# Altium project Main_board1.PrjPcb
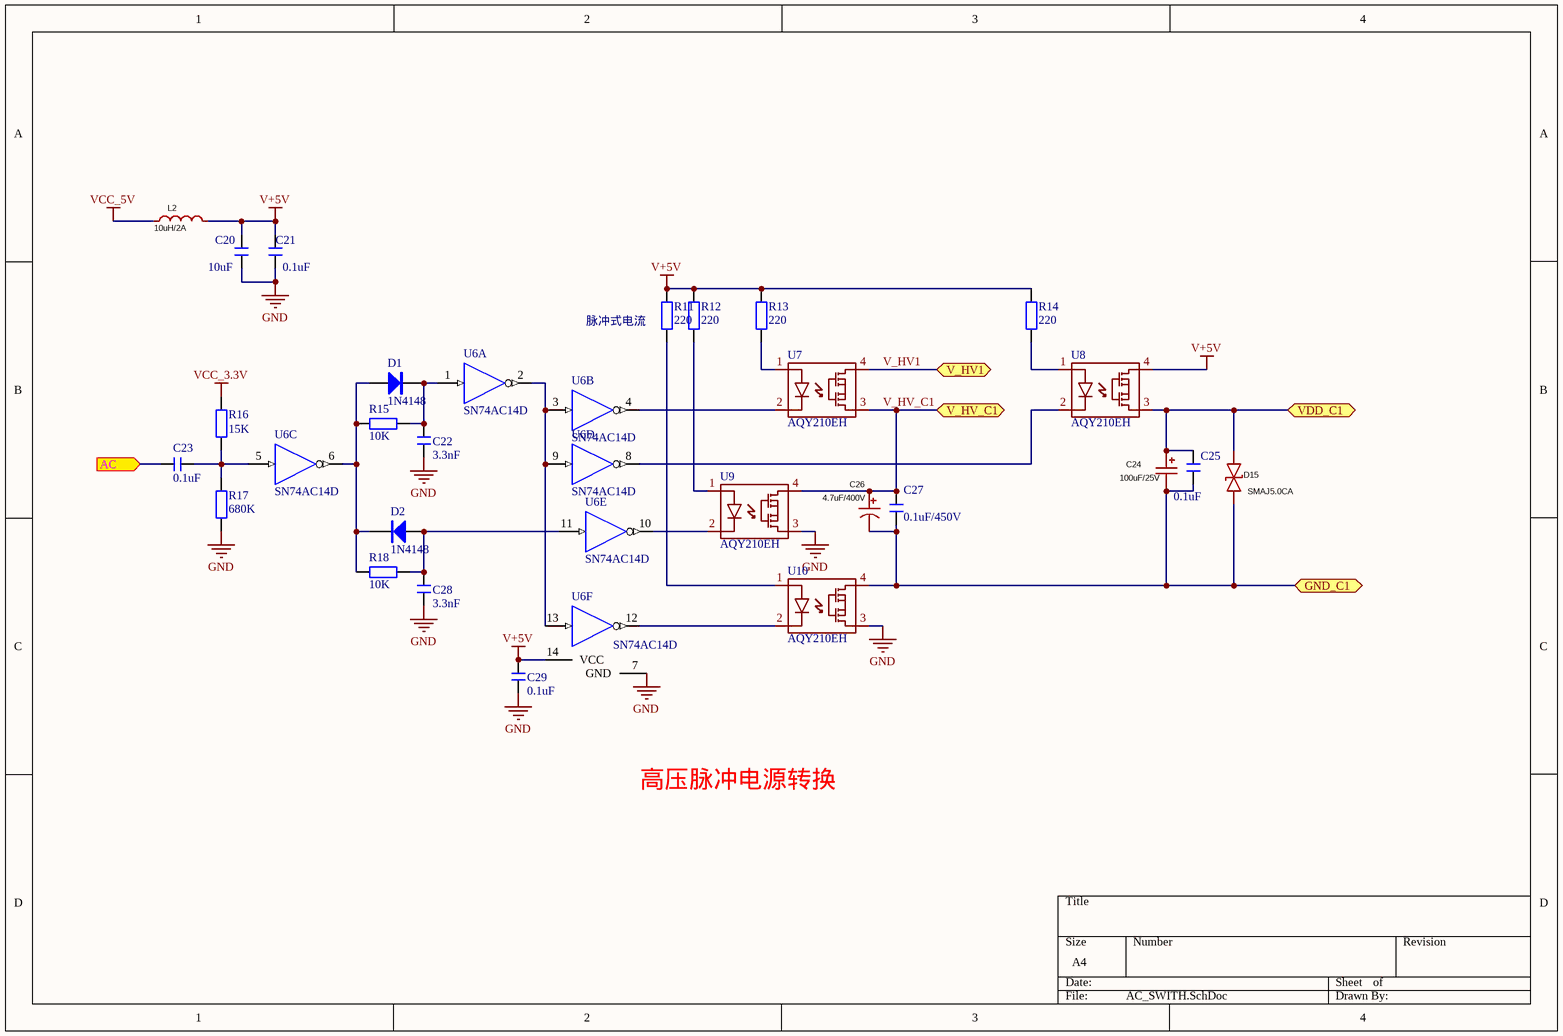
[diagram p0: AC_SWITH.SchDoc]
5 sheets, 102 parts. Net scope: flat (ports and power ports of the same name join across sheets).
Board file: BD1_yd_V1.0.PcbDoc
Sheets:
  AC_SWITH.SchDoc
  ArrayPCIE.SchDoc
  ISO_signal.SchDoc
  Feedback.SchDoc
  Connect.SchDoc

## Sheet AC_SWITH.SchDoc
size A4

### Parts
C20  10uF  [C 0805]
C21  0.1uF  [C 0603]
C22  3.3nF  [C 0603]
C23  0.1uF  [C 0603]
C24  100uF/25V  [CASE-D_7343]
C25  0.1uF  [C 0603]
C26  4.7uF/400V  [CAP-TH_BD8.0-P3.50-D0.6-FD]
C27  0.1uF/450V  [C 1206]
C28  3.3nF  [C 0603]
C29  0.1uF  [C 0603]
D1  1N4148  [SOD-323]
D2  1N4148  [SOD-323]
D15  SMAJ5.0CA  [SMA_L4.4-W2.6-LS5.0-BI]
L2  10uH/2A  [IND-SMD_L5.0-W5.0_LQH5BPBXX]
R11  220  [R 0603]
R12  220  [R 0603]
R13  220  [R 0603]
R14  220  [R 0603]
R15  10K  [R 0603]
R16  15K  [R 0603]
R17  680K  [R 0603]
R18  10K  [R 0603]
U6  SN74AC14D  [SOIC-14_L8.7-W3.9-P1.27-LS6.0-BL]  (parts A,B,C,D,E,F of 6)
U7  AQY210EH  [RELAY-SMD_AQY210EHAX]
U8  AQY210EH  [RELAY-SMD_AQY210EHAX]
U9  AQY210EH  [RELAY-SMD_AQY210EHAX]
U10  AQY210EH  [RELAY-SMD_AQY210EHAX]

### Ports
AC (in), GND_C1, V_HV1, V_HV_C1, VDD_C1

### Nets
GND: C20.1 C21.2 C22.2 C28.2 C29.2 R17.1 U6.7(GND) U9.3(A) U10.3(A)
V+5V: C20.2 C21.1 C29.1 L2.2 R11.1 R12.1 R13.1 R14.1 U6.14(VCC) U8.4(A)
VCC_3.3V: R16.2
VCC_5V: L2.1
GND_C1: C24.2 C25.2 C26.2 C27.1 D15.1 U10.4(A) ; port GND_C1
V_HV1: U7.4(A) ; port V_HV1
V_HV_C1: C26.1 C27.2 U7.3(A) U9.4(A) ; port V_HV_C1
VDD_C1: C24.1 C25.1 D15.2 U8.3(A) ; port VDD_C1
NetC22_1: C22.1 D1.2(K) R15.1 U6.1(A)
NetC23_1: C23.1 R16.1 R17.2 U6.5(A)
NetC23_2: C23.2 ; port AC
NetC28_1: C28.1 D2.1(A) R18.1 U6.11(A)
NetD1_1: D1.1(A) D2.2(K) R15.2 R18.2 U6.6(Y)
NetR11_2: R11.2 U10.1(A)
NetR12_2: R12.2 U9.1(A)
NetR13_2: R13.2 U7.1(A)
NetR14_2: R14.2 U8.1(A)
NetU6_2: U6.2(Y) U6.3(A) U6.9(A) U6.13(A)
NetU6_4: U6.4(Y) U7.2(A)
NetU6_8: U6.8(Y) U8.2(A)
NetU6_10: U6.10(Y) U9.2(A)
NetU6_12: U6.12(Y) U10.2(A)

### Notes on the sheet
- 脉冲式电流
- 高压脉冲电源转换

### Library data of the parts
C20-C23 C25 C27-C29 = C: 无极性贴片电容; 版权归属: 源创客; BOM名称: 无极性贴片电容; 学习资源: www.ooocke.com
C24 = TAJD107K016RNJ: Manufacturer: Kyocera AVX; Add into BOM: yes; Value: 100uF; Rated Voltage: 16V; Symbol: TAJD107K016RNJ; Device: TAJD107K016RNJ; Supplier Part: C7223; Manufacturer Part: TAJD107K016RNJ; Supplier Footprint: CASE-D-7343; JLCPCB Part Class: Extended Part; Datasheet: https://atta.szlcsc.com/upload/public/pdf/source/20160107/1457707750344.pdf; Supplier: LCSC; Convert to PCB: yes
C26 = ERK2GM4R7F09OT: Add into BOM: yes; Value: 4.7uF; Rated Voltage: 400V; Ripple Current: 94mA@100kHz; L: 9mm; Symbol: ERK2GM4R7F09OT; Device: ERK2GM4R7F09OT; Supplier Part: C112499; Manufacturer Part: ERK2GM4R7F09OT; JLCPCB Part Class: Extended Part; Datasheet: https://atta.szlcsc.com/upload/public/pdf/source/20200117/C486002_277F2A16EBB2F90C92EEA28887F58F34.pdf; Supplier: LCSC; Convert to PCB: yes; Equivalent Series Resistance(ESR): -; Lead Spacing: 3.5mm
D1 D2 = 1N4148: 高速开关二极管; 版权归属: 源创客; BOM名称: 高速开关二极管; 学习资源: www.ooocke.com
D15 = SMAJ5.0CA_C83324: Symbol: SMAJ5.0CA-C83324; Add into BOM: yes; Reverse Stand-Off Voltage (Vrwm): 5V; Maximum Clamping Voltage: 9.2V; Peak Pulse Current (Ipp)@10/1000us: 43.5A; Peak Pulse Power Dissipation (Ppp)@10/1000us: 400W; Breakdown Voltage: 6.4V; Type: TVS; Device: SMAJ5.0CA_C83324; Supplier Part: C83324; Manufacturer Part: SMAJ5.0CA; Supplier Footprint: SMA(DO-214AC); JLCPCB Part Class: Extended Part; Datasheet: https://atta.szlcsc.com/upload/public/pdf/source/20190402/C374025_5ACE77BC72947DF13CF0CBC7F8B57228.pdf; Supplier: LCSC; Convert to PCB: yes
L2 = LQH5BPB100MT0L: Add into BOM: yes; Value: 10uH; Rated Current: 1.6A; Saturation Current (Isat): 2A; Symbol: LQH5BPB100MT0L; Device: LQH5BPB100MT0L; Supplier Part: C521243; Manufacturer Part: LQH5BPB100MT0L; Supplier Footprint: SMD,5x5mm; JLCPCB Part Class: Extended Part; Datasheet: https://atta.szlcsc.com/upload/public/pdf/source/20200424/C521243_DFE491869978DAC178DAE514CEE77DDD.pdf; Supplier: LCSC; Convert to PCB: yes; Ratings: -
R11-R18 = R: 贴片电阻; 版权归属: 源创客; BOM名称: 贴片电阻; 学习资源: www.ooocke.com
U6 = SN74LS14D: Hex Schmitt-Trigger Inverter; Published: 8-Jun-2000; LatestRevisionDate: 13-Apr-2006; LatestRevisionNote: IPC-7351 Footprint Added.; DatasheetVersion: Mar-1988; PackageVersion: Jan-1998; PackageReference: D014; Publisher: Altium Limited; PackageDescription: 14-Pin Small Outline Integrated Circuit 1.27 mm Pitch; Code_IPC: SOIC127P600-14; ComponentLink1Description: Manufacturer Link; ComponentLink1URL: http://www.ti.com/; ComponentLink2Description: Datasheet; ComponentLink2URL: http://www-s.ti.com/sc/ds/sn74ls14.pdf

## Sheet ArrayPCIE.SchDoc
size B
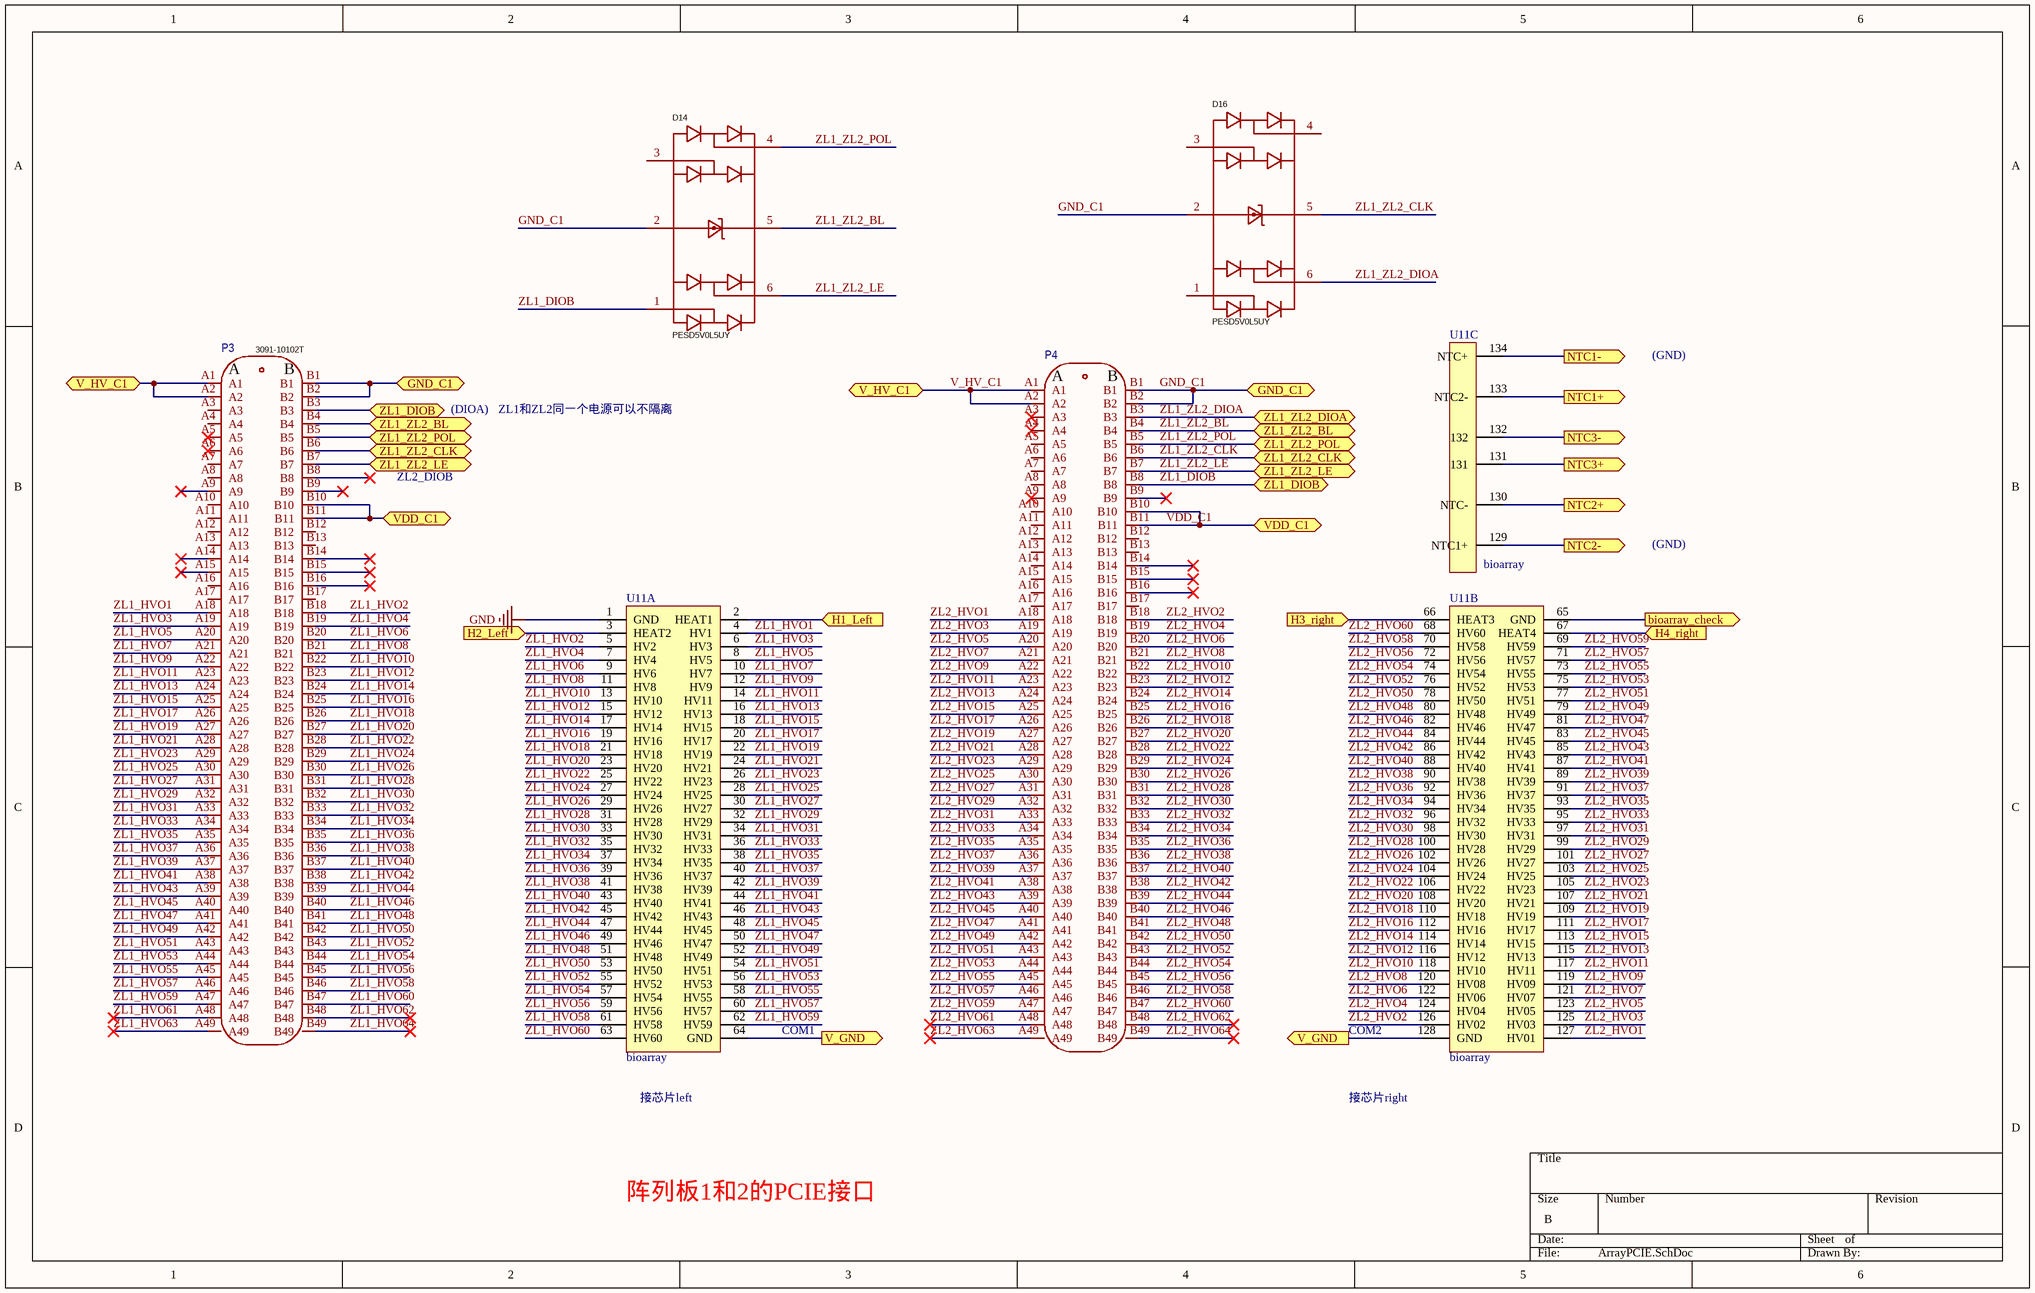
[diagram p1: ArrayPCIE.SchDoc]

### Parts
D14  PESD5V0L5UY  [SOT-363_L2.1-W1.3-P0.65-LS2.2-BL]
D16  PESD5V0L5UY  [SOT-363_L2.1-W1.3-P0.65-LS2.2-BL]
P3  3091-10102T  [CONN-TH_98P-P1.00-V_3183-XXXXXPXT]
P4  3091-10102T  [CONN-TH_98P-P1.00-V_3183-XXXXXPXT]  (value not drawn)
U11  bioarray  [Bioarray]  (parts A,B,C of 3)

### Ports
bioarray_check (out), GND_C1, H1_Left (in), H2_Left (in), H3_right (in), H4_right (in), NTC1+ (out), NTC1- (out), NTC2+ (out), NTC2- (out), NTC3+ (out), NTC3- (out), V_GND (out), V_HV_C1, VDD_C1, ZL1_DIOB, ZL1_ZL2_BL, ZL1_ZL2_CLK, ZL1_ZL2_DIOA, ZL1_ZL2_LE, ZL1_ZL2_POL

### Nets
GND: U11.1(GND)
GND_C1: D14.2 D16.2 P3.B1 P3.B2 P4.B1 P4.B2 ; port GND_C1
V_HV_C1: P3.A1 P3.A2 P4.A1 P4.A2 ; port V_HV_C1
VDD_C1: P3.B10 P3.B11 P4.B10 P4.B11 ; port VDD_C1
ZL1_DIOB: D14.1 P3.B3 P4.B8 ; port ZL1_DIOB
ZL1_HVO1: P3.A18 U11.4(HV1)
ZL1_HVO2: P3.B18 U11.5(HV2)
ZL1_HVO3: P3.A19 U11.6(HV3)
ZL1_HVO4: P3.B19 U11.7(HV4)
ZL1_HVO5: P3.A20 U11.8(HV5)
ZL1_HVO6: P3.B20 U11.9(HV6)
ZL1_HVO7: P3.A21 U11.10(HV7)
ZL1_HVO8: P3.B21 U11.11(HV8)
ZL1_HVO9: P3.A22 U11.12(HV9)
ZL1_HVO10: P3.B22 U11.13(HV10)
ZL1_HVO11: P3.A23 U11.14(HV11)
ZL1_HVO12: P3.B23 U11.15(HV12)
ZL1_HVO13: P3.A24 U11.16(HV13)
ZL1_HVO14: P3.B24 U11.17(HV14)
ZL1_HVO15: P3.A25 U11.18(HV15)
ZL1_HVO16: P3.B25 U11.19(HV16)
ZL1_HVO17: P3.A26 U11.20(HV17)
ZL1_HVO18: P3.B26 U11.21(HV18)
ZL1_HVO19: P3.A27 U11.22(HV19)
ZL1_HVO20: P3.B27 U11.23(HV20)
ZL1_HVO21: P3.A28 U11.24(HV21)
ZL1_HVO22: P3.B28 U11.25(HV22)
ZL1_HVO23: P3.A29 U11.26(HV23)
ZL1_HVO24: P3.B29 U11.27(HV24)
ZL1_HVO25: P3.A30 U11.28(HV25)
ZL1_HVO26: P3.B30 U11.29(HV26)
ZL1_HVO27: P3.A31 U11.30(HV27)
ZL1_HVO28: P3.B31 U11.31(HV28)
ZL1_HVO29: P3.A32 U11.32(HV29)
ZL1_HVO30: P3.B32 U11.33(HV30)
ZL1_HVO31: P3.A33 U11.34(HV31)
ZL1_HVO32: P3.B33 U11.35(HV32)
ZL1_HVO33: P3.A34 U11.36(HV33)
ZL1_HVO34: P3.B34 U11.37(HV34)
ZL1_HVO35: P3.A35 U11.38(HV35)
ZL1_HVO36: P3.B35 U11.39(HV36)
ZL1_HVO37: P3.A36 U11.40(HV37)
ZL1_HVO38: P3.B36 U11.41(HV38)
ZL1_HVO39: P3.A37 U11.42(HV39)
ZL1_HVO40: P3.B37 U11.43(HV40)
ZL1_HVO41: P3.A38 U11.44(HV41)
ZL1_HVO42: P3.B38 U11.45(HV42)
ZL1_HVO43: P3.A39 U11.46(HV43)
ZL1_HVO44: P3.B39 U11.47(HV44)
ZL1_HVO45: P3.A40 U11.48(HV45)
ZL1_HVO46: P3.B40 U11.49(HV46)
ZL1_HVO47: P3.A41 U11.50(HV47)
ZL1_HVO48: P3.B41 U11.51(HV48)
ZL1_HVO49: P3.A42 U11.52(HV49)
ZL1_HVO50: P3.B42 U11.53(HV50)
ZL1_HVO51: P3.A43 U11.54(HV51)
ZL1_HVO52: P3.B43 U11.55(HV52)
ZL1_HVO53: P3.A44 U11.56(HV53)
ZL1_HVO54: P3.B44 U11.57(HV54)
ZL1_HVO55: P3.A45 U11.58(HV55)
ZL1_HVO56: P3.B45 U11.59(HV56)
ZL1_HVO57: P3.A46 U11.60(HV57)
ZL1_HVO58: P3.B46 U11.61(HV58)
ZL1_HVO59: P3.A47 U11.62(HV59)
ZL1_HVO60: P3.B47 U11.63(HV60)
ZL1_HVO61: P3.A48
ZL1_HVO62: P3.B48
ZL1_HVO63: P3.A49
ZL1_HVO64: P3.B49
ZL1_ZL2_BL: D14.5 P3.B4 P4.B4 ; port ZL1_ZL2_BL
ZL1_ZL2_CLK: D16.5 P3.B6 P4.B6 ; port ZL1_ZL2_CLK
ZL1_ZL2_DIOA: D16.6 P4.B3 ; port ZL1_ZL2_DIOA
ZL1_ZL2_LE: D14.6 P3.B7 P4.B7 ; port ZL1_ZL2_LE
ZL1_ZL2_POL: D14.4 P3.B5 P4.B5 ; port ZL1_ZL2_POL
ZL2_HVO1: P4.A18 U11.127(HV01)
ZL2_HVO2: P4.B18 U11.126(HV02)
ZL2_HVO3: P4.A19 U11.125(HV03)
ZL2_HVO4: P4.B19 U11.124(HV04)
ZL2_HVO5: P4.A20 U11.123(HV05)
ZL2_HVO6: P4.B20 U11.122(HV06)
ZL2_HVO7: P4.A21 U11.121(HV07)
ZL2_HVO8: P4.B21 U11.120(HV08)
ZL2_HVO9: P4.A22 U11.119(HV09)
ZL2_HVO10: P4.B22 U11.118(HV10)
ZL2_HVO11: P4.A23 U11.117(HV11)
ZL2_HVO12: P4.B23 U11.116(HV12)
ZL2_HVO13: P4.A24 U11.115(HV13)
ZL2_HVO14: P4.B24 U11.114(HV14)
ZL2_HVO15: P4.A25 U11.113(HV15)
ZL2_HVO16: P4.B25 U11.112(HV16)
ZL2_HVO17: P4.A26 U11.111(HV17)
ZL2_HVO18: P4.B26 U11.110(HV18)
ZL2_HVO19: P4.A27 U11.109(HV19)
ZL2_HVO20: P4.B27 U11.108(HV20)
ZL2_HVO21: P4.A28 U11.107(HV21)
ZL2_HVO22: P4.B28 U11.106(HV22)
ZL2_HVO23: P4.A29 U11.105(HV23)
ZL2_HVO24: P4.B29 U11.104(HV24)
ZL2_HVO25: P4.A30 U11.103(HV25)
ZL2_HVO26: P4.B30 U11.102(HV26)
ZL2_HVO27: P4.A31 U11.101(HV27)
ZL2_HVO28: P4.B31 U11.100(HV28)
ZL2_HVO29: P4.A32 U11.99(HV29)
ZL2_HVO30: P4.B32 U11.98(HV30)
ZL2_HVO31: P4.A33 U11.97(HV31)
ZL2_HVO32: P4.B33 U11.96(HV32)
ZL2_HVO33: P4.A34 U11.95(HV33)
ZL2_HVO34: P4.B34 U11.94(HV34)
ZL2_HVO35: P4.A35 U11.93(HV35)
ZL2_HVO36: P4.B35 U11.92(HV36)
ZL2_HVO37: P4.A36 U11.91(HV37)
ZL2_HVO38: P4.B36 U11.90(HV38)
ZL2_HVO39: P4.A37 U11.89(HV39)
ZL2_HVO40: P4.B37 U11.88(HV40)
ZL2_HVO41: P4.A38 U11.87(HV41)
ZL2_HVO42: P4.B38 U11.86(HV42)
ZL2_HVO43: P4.A39 U11.85(HV43)
ZL2_HVO44: P4.B39 U11.84(HV44)
ZL2_HVO45: P4.A40 U11.83(HV45)
ZL2_HVO46: P4.B40 U11.82(HV46)
ZL2_HVO47: P4.A41 U11.81(HV47)
ZL2_HVO48: P4.B41 U11.80(HV48)
ZL2_HVO49: P4.A42 U11.79(HV49)
ZL2_HVO50: P4.B42 U11.78(HV50)
ZL2_HVO51: P4.A43 U11.77(HV51)
ZL2_HVO52: P4.B43 U11.76(HV52)
ZL2_HVO53: P4.A44 U11.75(HV53)
ZL2_HVO54: P4.B44 U11.74(HV54)
ZL2_HVO55: P4.A45 U11.73(HV55)
ZL2_HVO56: P4.B45 U11.72(HV56)
ZL2_HVO57: P4.A46 U11.71(HV57)
ZL2_HVO58: P4.B46 U11.70(HV58)
ZL2_HVO59: P4.A47 U11.69(HV59)
ZL2_HVO60: P4.B47 U11.68(HV60)
ZL2_HVO61: P4.A48
ZL2_HVO62: P4.B48
ZL2_HVO63: P4.A49
ZL2_HVO64: P4.B49
NetC46_1: U11.64(GND) U11.128(GND) ; port V_GND
NetP30_3: U11.3(HEAT2) ; port H2_Left
NetP30_5: U11.2(HEAT1) ; port H1_Left
NetP30_7: U11.66(HEAT3) ; port H3_right
NetP30_9: U11.67(HEAT4) ; port H4_right
NetP30_15: U11.133(NTC2-) ; port NTC1+
NetP30_16: U11.134(NTC+) ; port NTC1-
NetP30_17: U11.130(NTC-) ; port NTC2+
NetP30_18: U11.129(NTC1+) ; port NTC2-
NetP30_19: U11.131 ; port NTC3+
NetP30_20: U11.132 ; port NTC3-
NetR40_2: U11.65(GND) ; port bioarray_check

Not connected (* = marked no-connect by the designer): D14 3; D16 1 3 4; P3 A3 A4 A5* A6* A7 A8 A9* A10 A11 A12 A13 A14* A15* A16 A17 B8* B9* B12 B13 B14* B15* B16* B17; P4 A3* A4* A5 A6 A7 A8 A9* A10 A11 A12 A13 A14 A15 A16 A17 B9* B12 B13 B14* B15* B16* B17

### Notes on the sheet
- (GND)
- (DIOA)
- ZL1和ZL2同一个电源可以不隔离
- ZL2_DIOB
- COM1
- COM2
- 接芯片left
- 接芯片right
- 阵列板1和2的PCIE接口
- (in symbol 3091-10102T) A; B

### Library data of the parts
D14 D16 = PESD5V0L5UY: Symbol: PESD5V0L5UY_C2831528; Add into BOM: yes; Device: PESD5V0L5UY; LCSC Part Name: PESD5V0L5UY; Supplier Part: C2831528; Manufacturer Part: PESD5V0L5UY; Supplier Footprint: SOT-363; JLCPCB Part Class: Extended Part; Datasheet: https://atta.szlcsc.com/upload/public/pdf/source/20231109/DCE732989771725E823DBBA058DFF8E3.pdf; Supplier: LCSC; Convert to PCB: yes
P3 P4 = 3091-10102T: Add into BOM: yes; Connector Type: PCI-E x8; Number of Data Pins: 76P; Body Height: 9.4mm; Symbol: 3091-10102T; Device: 3091-10102T; Supplier Part: C444346; Manufacturer Part: 3091-10102T; JLCPCB Part Class: Extended Part; Datasheet: https://atta.szlcsc.com/upload/public/pdf/source/20221109/CB0226233DC893B6403D2B106A3D8F66.pdf; Supplier: LCSC; Convert to PCB: yes; Number of Pins: 98P; Versions: -; Operating Temperature Range: -; Comment_1: 3091-10102T

## Sheet ISO_signal.SchDoc
size A4
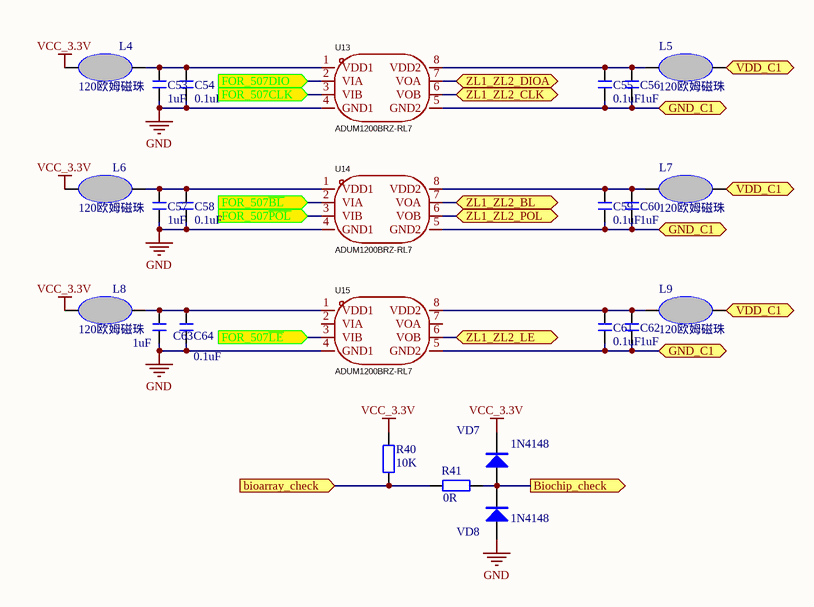
[diagram p2: ISO_signal.SchDoc]

### Parts
C53  1uF  [C 0603]
C54  0.1uF  [C 0603]
C55  0.1uF  [C 0603]
C56  1uF  [C 0603]
C57  1uF  [C 0603]
C58  0.1uF  [C 0603]
C59  0.1uF  [C 0603]
C60  1uF  [C 0603]
C61  0.1uF  [C 0603]
C62  1uF  [C 0603]
C63  1uF  [C 0603]
C64  0.1uF  [C 0603]
L4  120欧姆磁珠  [L 0603]
L5  120欧姆磁珠  [L 0603]
L6  120欧姆磁珠  [L 0603]
L7  120欧姆磁珠  [L 0603]
L8  120欧姆磁珠  [L 0603]
L9  120欧姆磁珠  [L 0603]
R40  10K  [R 0603]
R41  0R  [R 0603]
U13  ADUM1200BRZ-RL7  [SOIC-8_L4.9-W3.9-P1.27-LS6.0-BL]
U14  ADUM1200BRZ-RL7  [SOIC-8_L4.9-W3.9-P1.27-LS6.0-BL]
U15  ADUM1200BRZ-RL7  [SOIC-8_L4.9-W3.9-P1.27-LS6.0-BL]
VD7  1N4148  [SOD-323]
VD8  1N4148  [SOD-323]

### Ports
bioarray_check (in), Biochip_check (out), FOR_507CLK (in), FOR_507DIO (in), FOR_507~{BL} (in), FOR_507~{LE} (in), FOR_507~{POL} (in), GND_C1, VDD_C1, ZL1_ZL2_BL, ZL1_ZL2_CLK, ZL1_ZL2_DIOA, ZL1_ZL2_LE, ZL1_ZL2_POL

### Nets
GND: C53.2 C54.2 C57.2 C58.2 C63.2 C64.2 U13.4(GND1) U14.4(GND1) U15.4(GND1) VD8.1(A)
VCC_3.3V: L4.1 L6.1 L8.1 R40.1 VD7.2(K)
GND_C1: C55.2 C56.2 C59.2 C60.2 C61.2 C62.2 U13.5(GND2) U14.5(GND2) U15.5(GND2) ; port GND_C1
VDD_C1: L5.2 L7.2 L9.2 ; port VDD_C1
ZL1_ZL2_BL: U14.7(VOA) ; port ZL1_ZL2_BL
ZL1_ZL2_CLK: U13.6(VOB) ; port ZL1_ZL2_CLK
ZL1_ZL2_DIOA: U13.7(VOA) ; port ZL1_ZL2_DIOA
ZL1_ZL2_LE: U15.6(VOB) ; port ZL1_ZL2_LE
ZL1_ZL2_POL: U14.6(VOB) ; port ZL1_ZL2_POL
NetC53_1: C53.1 C54.1 L4.2 U13.1(VDD1)
NetC55_1: C55.1 C56.1 L5.1 U13.8(VDD2)
NetC57_1: C57.1 C58.1 L6.2 U14.1(VDD1)
NetC59_1: C59.1 C60.1 L7.1 U14.8(VDD2)
NetC61_1: C61.1 C62.1 L9.1 U15.8(VDD2)
NetC63_1: C63.1 C64.1 L8.2 U15.1(VDD1)
NetP21_4: U13.3(VIB) ; port FOR_507CLK
NetP21_6: U13.2(VIA) ; port FOR_507DIO
NetP21_7: R41.1 VD7.1(A) VD8.2(K) ; port Biochip_check
NetP21_8: U14.3(VIB) ; port FOR_507~{POL}
NetP21_10: U14.2(VIA) ; port FOR_507~{BL}
NetP21_12: U15.3(VIB) ; port FOR_507~{LE}
NetR40_2: R40.2 R41.2 ; port bioarray_check

Not connected (* = marked no-connect by the designer): U15 2(VIA) 7(VOA)

### Library data of the parts
C53-C64 = C-CC: 直插瓷片电容; 版权归属: 源创客; BOM名称: 直插瓷片电容; 学习资源: www.ooocke.com
L4-L9 = FERRITBEAD
R40 R41 = R: 贴片电阻; 版权归属: 源创客; BOM名称: 贴片电阻; 学习资源: www.ooocke.com
U13-U15 = ADUM1200BRZ-RL7: Add into BOM: yes; Number of Forward Channels: 2; Number of Reverse Channels: 0; Data Rate(Max): 25Mbps; Isolation Voltage(Vrms): 2500; CMTI(kV/us): 25kV/us; Symbol: ADUM1200BRZ; Device: ADUM1200BRZ-RL7; Supplier Part: C30230; Manufacturer Part: ADUM1200BRZ-RL7; Supplier Footprint: SOIC-8; JLCPCB Part Class: Extended Part; Datasheet: https://atta.szlcsc.com/upload/public/pdf/source/20140418/1457707045216.pdf; Supplier: LCSC; Convert to PCB: yes; Default Output: -; Rating: -; Comment_1: ADUM1200BRZ-RL7
VD7 VD8 = 1N4148: 高速开关二极管; 版权归属: 源创客; BOM名称: 高速开关二极管; 学习资源: www.ooocke.com

## Sheet Feedback.SchDoc
size A4
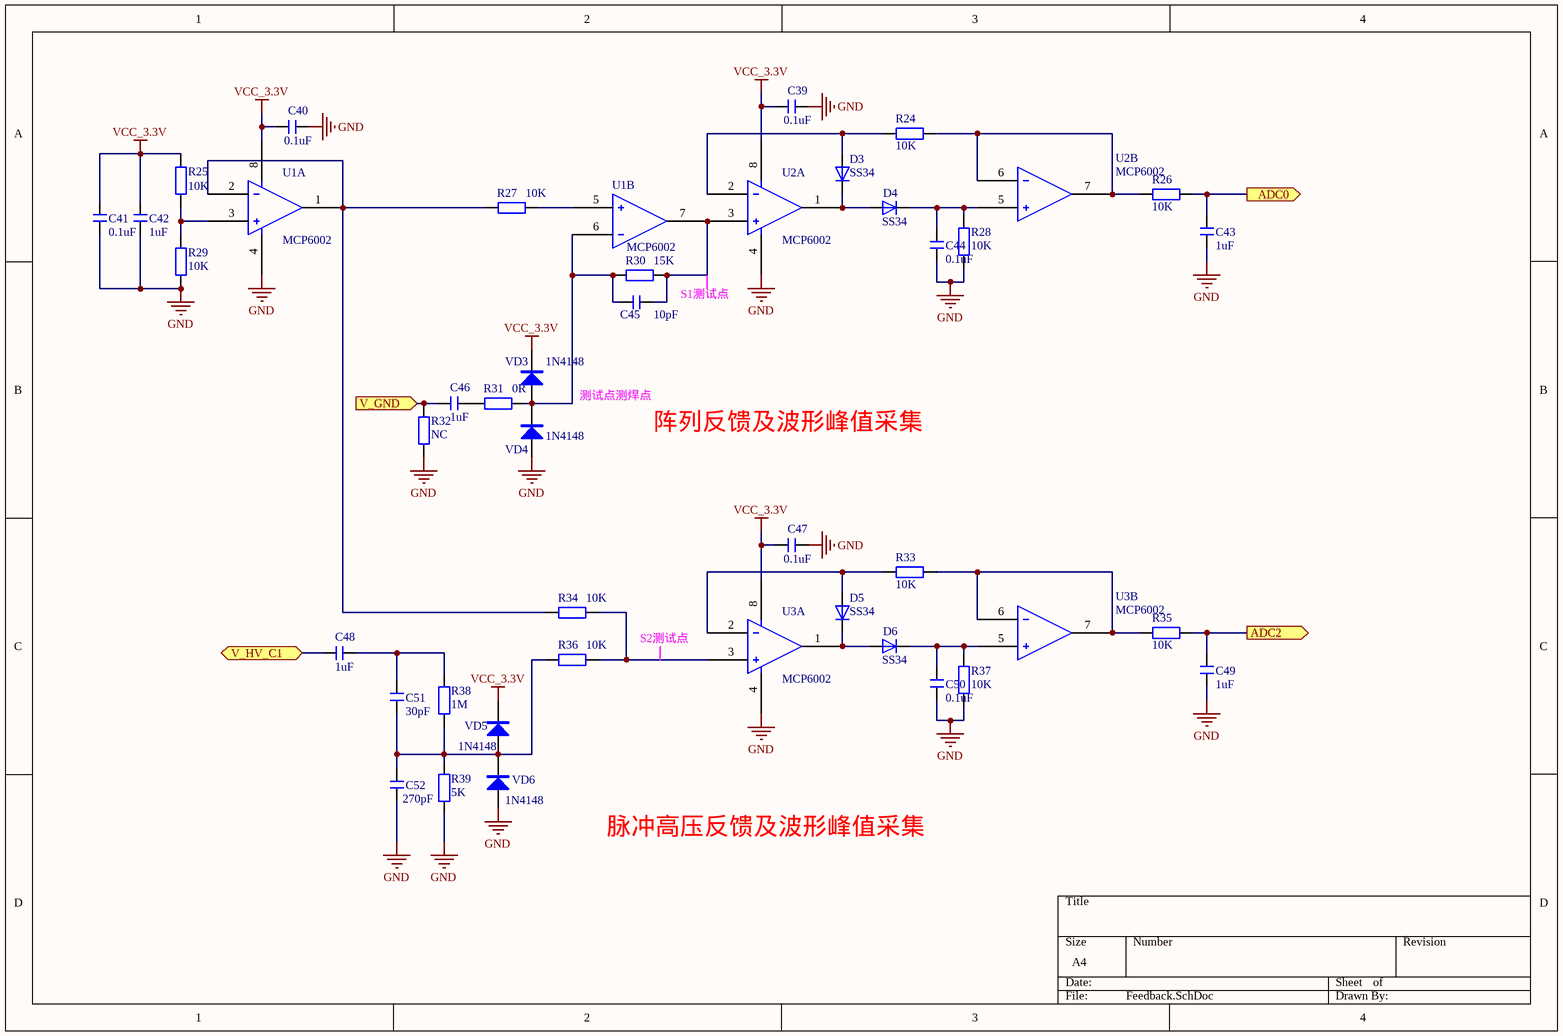
[diagram p3: Feedback.SchDoc]

### Parts
C39  0.1uF  [C 0603]
C40  0.1uF  [C 0603]
C41  0.1uF  [C 0603]
C42  1uF  [C 0603]
C43  1uF  [C 0603]
C44  0.1uF  [C 0603]
C45  10pF  [C 0603]
C46  1uF  [C 0805]
C47  0.1uF  [C 0603]
C48  1uF  [C 0805]
C49  1uF  [C 0603]
C50  0.1uF  [C 0603]
C51  30pF  [C 0805]
C52  270pF  [C 0805]
D3  SS34  [SMA]
D4  SS34  [SMA]
D5  SS34  [SMA]
D6  SS34  [SMA]
R24  10K  [R 0603]
R25  10K  [R 0603]
R26  10K  [R 0603]
R27  10K  [R 0603]
R28  10K  [R 0603]
R29  10K  [R 0603]
R30  15K  [R 0603]
R31  0R  [R 0603]
R32  NC  [R 0805]
R33  10K  [R 0603]
R34  10K  [R 0603]
R35  10K  [R 0603]
R36  10K  [R 0603]
R37  10K  [R 0603]
R38  1M  [R 0805]
R39  5K  [R 0805]
U1  MCP6002  [SOP8_N]  (parts A,B of 2)
U2  MCP6002  [SOP8_N]  (parts A,B of 2)
U3  MCP6002  [SOP8_N]  (parts A,B of 2)
VD3  1N4148  [SOD-323]
VD4  1N4148  [SOD-323]
VD5  1N4148  [SOD-323]
VD6  1N4148  [SOD-323]

### Ports
ADC0 (out), ADC2 (out), V_GND (in), V_HV_C1

### Nets
GND: C39.2 C40.2 C41.2 C42.2 C43.1 C44.1 C47.2 C49.1 C50.1 C52.1 R28.2 R29.1 R32.2 R37.2 R39.1 U1.4 U2.4 U3.4 VD4.1(A) VD6.1(A)
VCC_3.3V: C39.1 C40.1 C41.1 C42.1 C47.1 R25.2 U1.8 U2.8 U3.8 VD3.2(K) VD5.2(K)
V_HV_C1: C48.1 ; port V_HV_C1
NetC43_2: C43.2 R26.1 ; port ADC0
NetC44_2: C44.2 D4.2(A) R28.1 U2.5
NetC45_1: C45.1 R30.2 R31.1 U1.6 VD3.1(A) VD4.2(K)
NetC45_2: C45.2 R30.1 U1.7 U2.3
NetC46_1: C46.1 R32.1 ; port V_GND
NetC46_2: C46.2 R31.2
NetC48_2: C48.2 C51.2 R38.2
NetC49_2: C49.2 R35.1 ; port ADC2
NetC50_2: C50.2 D6.2(A) R37.1 U3.5
NetC51_1: C51.1 C52.2 R36.2 R38.1 R39.2 VD5.1(A) VD6.2(K)
NetD3_1: D3.1(K) R24.2 U2.2
NetD3_2: D3.2(A) D4.1(K) U2.1
NetD5_1: D5.1(K) R33.2 U3.2
NetD5_2: D5.2(A) D6.1(K) U3.1
NetR24_1: R24.1 R26.2 U2.6 U2.7
NetR25_1: R25.1 R29.2 U1.3
NetR27_1: R27.1 U1.5
NetR27_2: R27.2 R34.2 U1.1 U1.2
NetR33_1: R33.1 R35.2 U3.6 U3.7
NetR34_1: R34.1 R36.1 U3.3

### Notes on the sheet
- S1测试点
- 测试点测焊点
- 阵列反馈及波形峰值采集
- S2测试点
- 脉冲高压反馈及波形峰值采集

### Library data of the parts
C39-C52 = C: 无极性贴片电容; 版权归属: 源创客; BOM名称: 无极性贴片电容; 学习资源: www.ooocke.com
D3-D6 = 1N4148
R24-R39 = R: 贴片电阻; 版权归属: 源创客; BOM名称: 贴片电阻; 学习资源: www.ooocke.com
U1-U3 = AD823AN
VD3-VD6 = 1N4148: 高速开关二极管; 版权归属: 源创客; BOM名称: 高速开关二极管; 学习资源: www.ooocke.com

## Sheet Connect.SchDoc
size A4
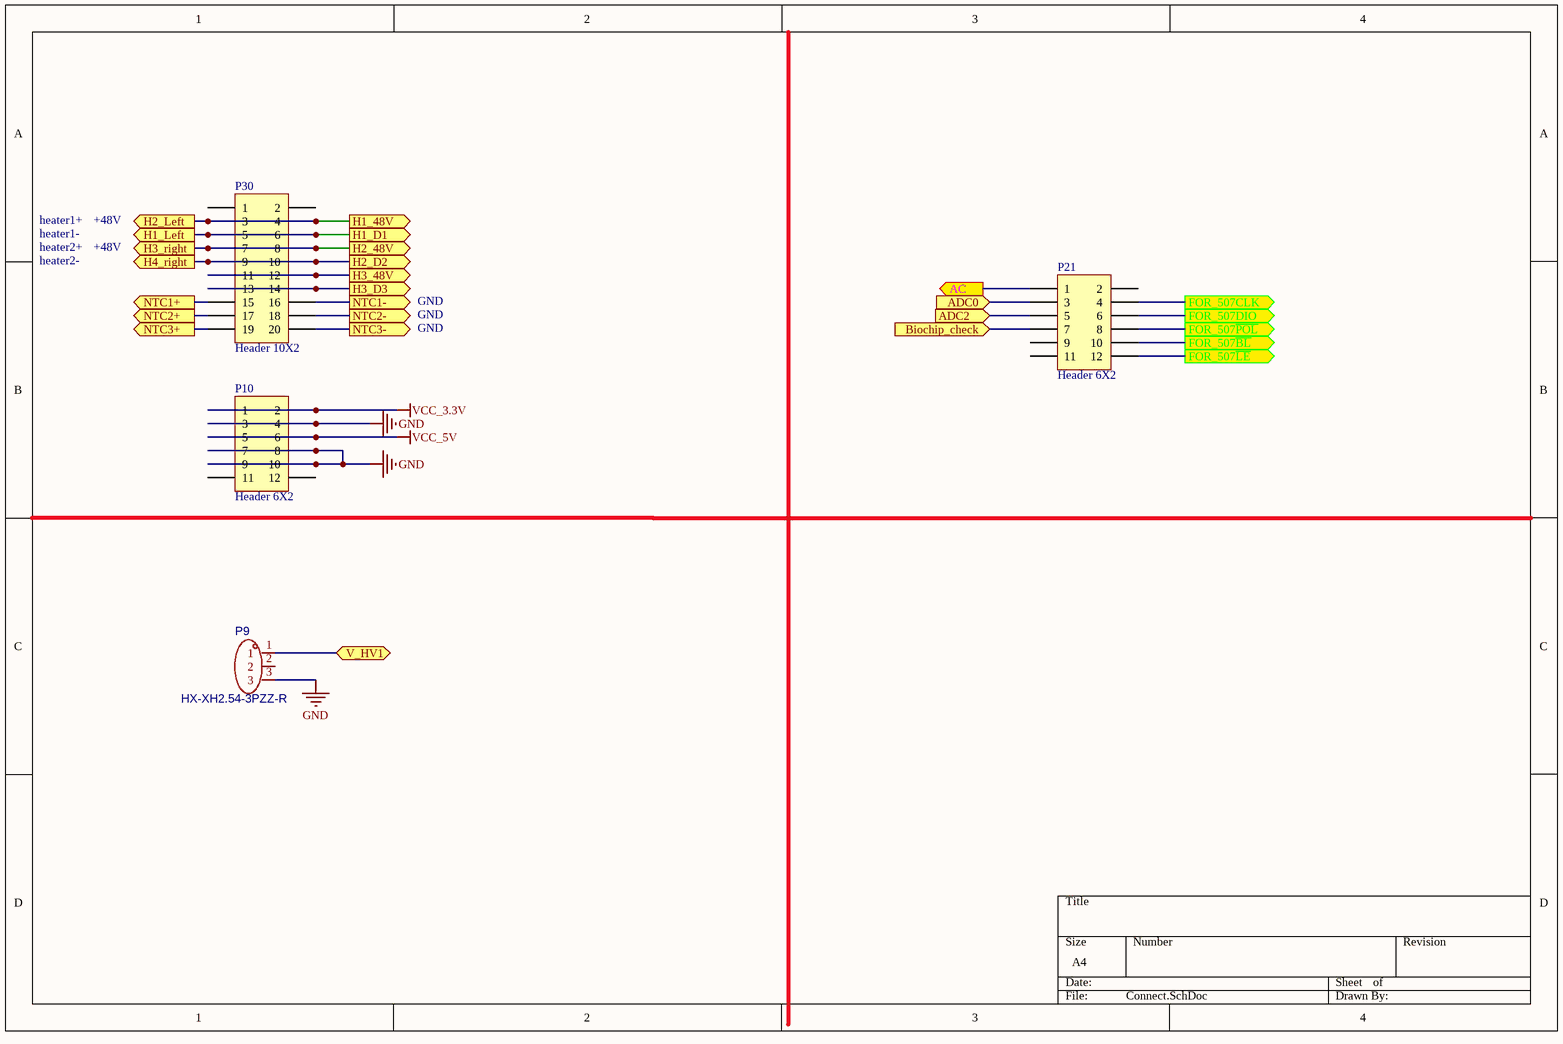
[diagram p4: Connect.SchDoc]

### Parts
P9  HX-XH2.54-3PZZ-R  [CONN-TH_3P-P2.50_HX-XH2.54-3PZZ-B]
P10  Header 6X2  [HDR-6X2]
P21  Header 6X2  [HDR-6X2]
P30  Header 10X2  [HDR-10X2]

### Ports
AC (out), ADC0 (in), ADC2 (in), Biochip_check (in), FOR_507CLK (out), FOR_507DIO (out), FOR_507~{BL} (out), FOR_507~{LE} (out), FOR_507~{POL} (out), H1_48V (out), H1_D1 (out), H1_Left (out), H2_48V (out), H2_D2 (out), H2_Left (out), H3_48V (out), H3_D3 (out), H3_right (out), H4_right (out), NTC1+ (out), NTC1- (out), NTC2+ (out), NTC2- (out), NTC3+ (out), NTC3- (out), V_HV1

### Nets
GND: P9.3 P10.3 P10.4 P10.7 P10.8 P10.9 P10.10
VCC_3.3V: P10.1 P10.2
VCC_5V: P10.5 P10.6
V_HV1: P9.1 ; port V_HV1
NetC23_2: P21.1 ; port AC
NetC43_2: P21.3 ; port ADC0
NetC49_2: P21.5 ; port ADC2
NetP21_4: P21.4 ; port FOR_507CLK
NetP21_6: P21.6 ; port FOR_507DIO
NetP21_7: P21.7 ; port Biochip_check
NetP21_8: P21.8 ; port FOR_507~{POL}
NetP21_10: P21.10 ; port FOR_507~{BL}
NetP21_12: P21.12 ; port FOR_507~{LE}
NetP30_3: P30.3 P30.4 ; port H1_48V, port H2_Left
NetP30_5: P30.5 P30.6 ; port H1_D1, port H1_Left
NetP30_7: P30.7 P30.8 ; port H2_48V, port H3_right
NetP30_9: P30.9 P30.10 ; port H2_D2, port H4_right
NetP30_11: P30.11 P30.12 ; port H3_48V
NetP30_13: P30.13 P30.14 ; port H3_D3
NetP30_15: P30.15 ; port NTC1+
NetP30_16: P30.16 ; port NTC1-
NetP30_17: P30.17 ; port NTC2+
NetP30_18: P30.18 ; port NTC2-
NetP30_19: P30.19 ; port NTC3+
NetP30_20: P30.20 ; port NTC3-

Not connected (* = marked no-connect by the designer): P9 2; P10 11 12; P21 2 9 11; P30 1 2

### Notes on the sheet
- heater1+
- heater1-
- heater2+
- +48V
- heater2-
- GND

### Library data of the parts
P9 = HX-XH2.54-3PZZ-R: AddInBom: yes; Pins Structure: 1x3P; Pitch: 2.54mm; Reference Series: XH; Number of PINs Per Row: 3; Current Rating: 3A; Voltage Rating: 250V; Plastic Material: PA66; Flame Retardant Rating: UL94V-0; Symbol: HX-XH2.54-3PZZ-R; Device: HX-XH2.54-3PZZ-R; SupplierPart: C49010011; ManufacturerPart: HX-XH2.54-3PZZ-R; JLCPCB Part Class: Extended Part; Datasheet: https://item.szlcsc.com/datasheet/HX-XH2.54-3PZZ-R/51365932.html; Supplier: LCSC; ConvertToPcb: yes; FootprintName: CONN-TH_3P-P2.50_HX-XH2.54-3PZZ-B; Number of Pins: 3P; Number of Rows: 1; Row Spacing: -; Supplementary Features: -; Z-Height of the Board: -; X-Length of Bottom Edge on Board (Spacing Line): -; Y-Width of Bottom Edge on Board: -
P10 P21 = Header 6X2: Header, 6-Pin, Dual row; LatestRevisionDate: 17-Jul-2002; LatestRevisionNote: Re-released for DXP Platform.; Publisher: Altium Limited
P30 = Header 10X2: Header, 10-Pin, Dual row; LatestRevisionDate: 17-Jul-2002; LatestRevisionNote: Re-released for DXP Platform.; Publisher: Altium Limited

## Nets that join several sheets
GND: AC_SWITH (9 pins), ArrayPCIE (U11.1), ISO_signal (10 pins), Feedback (20 pins), Connect (7 pins)
VCC_3.3V: AC_SWITH (R16.2), ISO_signal (5 pins), Feedback (11 pins), Connect (P10.1 P10.2)
VCC_5V: AC_SWITH (L2.1), Connect (P10.5 P10.6)
GND_C1: AC_SWITH (6 pins), ArrayPCIE (6 pins), ISO_signal (9 pins)
NetC23_2: AC_SWITH (C23.2), Connect (P21.1)
NetC43_2: Feedback (C43.2 R26.1), Connect (P21.3)
NetC46_1: ArrayPCIE (U11.64 U11.128), Feedback (C46.1 R32.1)
NetC49_2: Feedback (C49.2 R35.1), Connect (P21.5)
NetP21_4: ISO_signal (U13.3), Connect (P21.4)
NetP21_6: ISO_signal (U13.2), Connect (P21.6)
NetP21_7: ISO_signal (R41.1 VD7.1 VD8.2), Connect (P21.7)
NetP21_8: ISO_signal (U14.3), Connect (P21.8)
NetP21_10: ISO_signal (U14.2), Connect (P21.10)
NetP21_12: ISO_signal (U15.3), Connect (P21.12)
NetP30_3: ArrayPCIE (U11.3), Connect (P30.3 P30.4)
NetP30_5: ArrayPCIE (U11.2), Connect (P30.5 P30.6)
NetP30_7: ArrayPCIE (U11.66), Connect (P30.7 P30.8)
NetP30_9: ArrayPCIE (U11.67), Connect (P30.9 P30.10)
NetP30_15: ArrayPCIE (U11.133), Connect (P30.15)
NetP30_16: ArrayPCIE (U11.134), Connect (P30.16)
NetP30_17: ArrayPCIE (U11.130), Connect (P30.17)
NetP30_18: ArrayPCIE (U11.129), Connect (P30.18)
NetP30_19: ArrayPCIE (U11.131), Connect (P30.19)
NetP30_20: ArrayPCIE (U11.132), Connect (P30.20)
NetR40_2: ArrayPCIE (U11.65), ISO_signal (R40.2 R41.2)
V_HV1: AC_SWITH (U7.4), Connect (P9.1)
V_HV_C1: AC_SWITH (C26.1 C27.2 U7.3 U9.4), ArrayPCIE (P3.A1 P3.A2 P4.A1 P4.A2), Feedback (C48.1)
VDD_C1: AC_SWITH (C24.1 C25.1 D15.2 U8.3), ArrayPCIE (P3.B10 P3.B11 P4.B10 P4.B11), ISO_signal (L5.2 L7.2 L9.2)
ZL1_ZL2_BL: ArrayPCIE (D14.5 P3.B4 P4.B4), ISO_signal (U14.7)
ZL1_ZL2_CLK: ArrayPCIE (D16.5 P3.B6 P4.B6), ISO_signal (U13.6)
ZL1_ZL2_DIOA: ArrayPCIE (D16.6 P4.B3), ISO_signal (U13.7)
ZL1_ZL2_LE: ArrayPCIE (D14.6 P3.B7 P4.B7), ISO_signal (U15.6)
ZL1_ZL2_POL: ArrayPCIE (D14.4 P3.B5 P4.B5), ISO_signal (U14.6)